# Altium schematic sheet Thunderscope_Rev5.3.SchDoc
size 297 x 209 mm
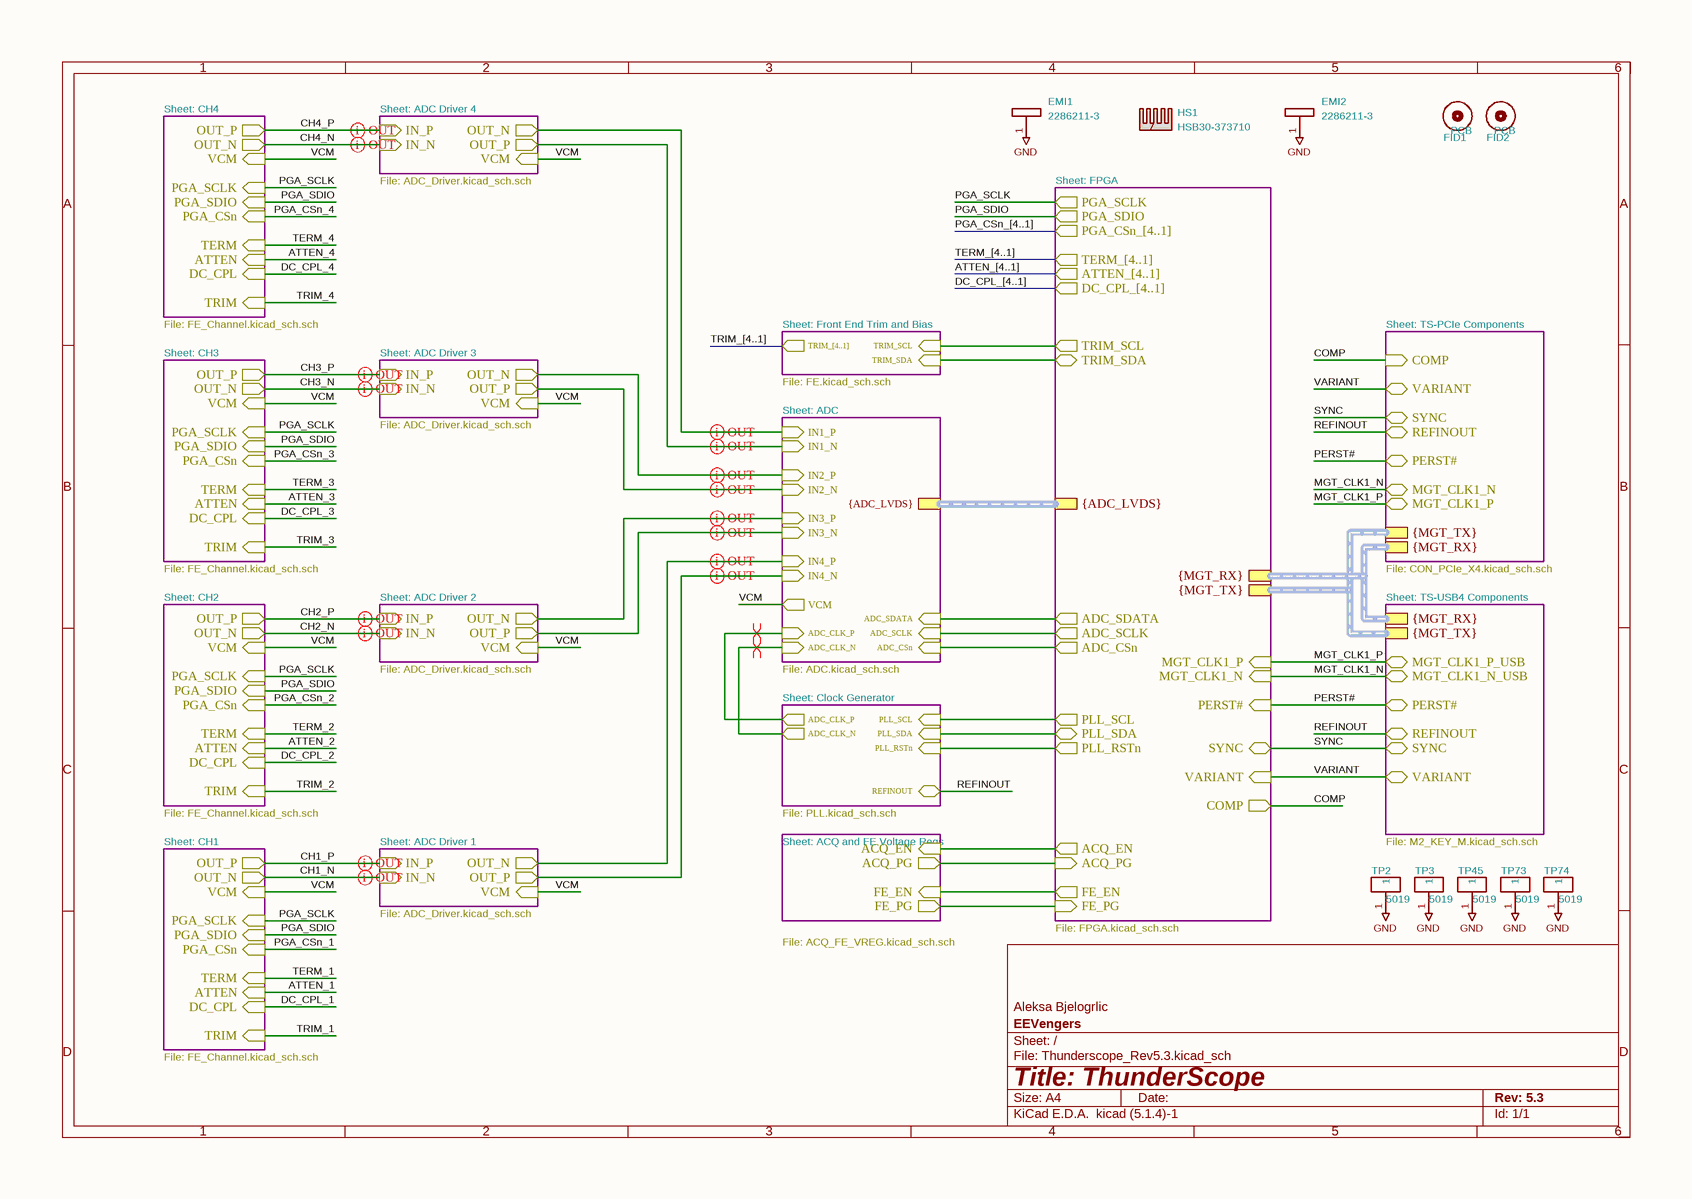
[diagram p0: Thunderscope_Rev5.3.SchDoc]

## Parts
EMI1  2286211-3  [TE_2286211-3]
EMI2  2286211-3  [TE_2286211-3]
FID1  PCB  [GEN_FID]
FID2  PCB  [GEN_FID]
HS1  HSB30-373710  [SSKY_HSB30-373710]  (mechanical)
TP2  5019  [KEY_5019]
TP3  5019  [KEY_5019]  (mechanical)
TP45  5019  [KEY_5019]  (mechanical)
TP73  5019  [KEY_5019]  (mechanical)
TP74  5019  [KEY_5019]  (mechanical)

## Sub-sheets
ACQ and FE Voltage Regs = ACQ_FE_VREG.SchDoc: FE_EN (in), ACQ_EN (in), FE_PG (out), ACQ_PG (out)
ADC = ADC.SchDoc: IN4_N (in), IN4_P (in), IN3_N (in), IN3_P (in), IN2_N (in), IN2_P (in), VCM (out), IN1_N (in), IN1_P (in), ADC_CSn (in), ADC_SDATA (in), ADC_SCLK (in), ADC_CLK_P (in), ADC_CLK_N (in), {ADC_LVDS} (harness ADC_LVDS)
ADC Driver 1 = ADC_Driver.SchDoc: VCM (in), OUT_N (out), OUT_P (out), IN_N (in), IN_P (in)
ADC Driver 2 = ADC_Driver.SchDoc: VCM (in), OUT_N (out), OUT_P (out), IN_N (in), IN_P (in)
ADC Driver 3 = ADC_Driver.SchDoc: VCM (in), OUT_N (out), OUT_P (out), IN_N (in), IN_P (in)
ADC Driver 4 = ADC_Driver.SchDoc: VCM (in), OUT_N (out), OUT_P (out), IN_N (in), IN_P (in)
CH1 = FE_Channel.SchDoc: OUT_P (out), VCM (in), OUT_N (out), TRIM (in), ATTEN (in), DC_CPL (in), PGA_CSn (in), PGA_SCLK (in), PGA_SDIO (in), TERM (in)
CH2 = FE_Channel.SchDoc: OUT_P (out), VCM (in), OUT_N (out), TRIM (in), ATTEN (in), DC_CPL (in), PGA_CSn (in), PGA_SCLK (in), PGA_SDIO (in), TERM (in)
CH3 = FE_Channel.SchDoc: OUT_P (out), VCM (in), OUT_N (out), TRIM (in), ATTEN (in), DC_CPL (in), PGA_CSn (in), PGA_SCLK (in), PGA_SDIO (in), TERM (in)
CH4 = FE_Channel.SchDoc: OUT_P (out), VCM (in), OUT_N (out), TRIM (in), ATTEN (in), DC_CPL (in), PGA_CSn (in), PGA_SCLK (in), PGA_SDIO (in), TERM (in)
Clock Generator = PLL.SchDoc: ADC_CLK_P (out), ADC_CLK_N (out), PLL_RSTn (in), PLL_SDA (in), PLL_SCL (in), REFINOUT (bidir)
FPGA = FPGA.SchDoc: PLL_RSTn (out), ADC_CSn (out), FE_EN (out), PGA_SDIO (out), PGA_SCLK (out), PLL_SCL (out), PLL_SDA (bidir), TRIM_SCL (out), TRIM_SDA (bidir), ADC_SDATA (out), ADC_SCLK (out), ACQ_EN (out), FE_PG (in), ACQ_PG (in), ATTEN_[4..1] (out), TERM_[4..1] (out), DC_CPL_[4..1] (out), PGA_CSn_[4..1] (out), SYNC (bidir), PERST# (in), MGT_CLK1_P (in), MGT_CLK1_N (in), VARIANT (in), COMP (out), {ADC_LVDS}, {MGT_TX}, {MGT_RX}
Front End Trim and Bias = FE.SchDoc: TRIM_SCL (in), TRIM_SDA (in), TRIM_[4..1] (out)
TS-PCIe Components = CON_PCIe_X4.SchDoc: PERST# (bidir), REFINOUT (bidir), SYNC (bidir), MGT_CLK1_N (bidir), MGT_CLK1_P (bidir), VARIANT (bidir), COMP (in), {MGT_RX} (harness MGT_RX), {MGT_TX} (harness MGT_TX)
TS-USB4 Components = M2_KEY_M.SchDoc: REFINOUT (bidir), SYNC (bidir), PERST# (bidir), MGT_CLK1_N_USB (bidir), MGT_CLK1_P_USB (bidir), VARIANT (bidir), {MGT_TX} (harness MGT_TX), {MGT_RX} (harness MGT_RX)

## Nets
GND: EMI1.1 EMI2.1 TP2.1 TP3.1 TP45.1 TP73.1 TP74.1
ATTEN_1: sheet CH1/ATTEN
ATTEN_2: sheet CH2/ATTEN
ATTEN_3: sheet CH3/ATTEN
ATTEN_4: sheet CH4/ATTEN
CH1_N: sheet ADC Driver 1/IN_N, sheet CH1/OUT_N
CH1_P: sheet ADC Driver 1/IN_P, sheet CH1/OUT_P
CH2_N: sheet ADC Driver 2/IN_N, sheet CH2/OUT_N
CH2_P: sheet ADC Driver 2/IN_P, sheet CH2/OUT_P
CH3_N: sheet CH3/OUT_N, sheet ADC Driver 3/IN_N
CH3_P: sheet CH3/OUT_P, sheet ADC Driver 3/IN_P
CH4_N: sheet CH4/OUT_N, sheet ADC Driver 4/IN_N
CH4_P: sheet CH4/OUT_P, sheet ADC Driver 4/IN_P
COMP: sheet FPGA/COMP, sheet TS-PCIe Components/COMP
DC_CPL_1: sheet CH1/DC_CPL
DC_CPL_2: sheet CH2/DC_CPL
DC_CPL_3: sheet CH3/DC_CPL
DC_CPL_4: sheet CH4/DC_CPL
MGT_CLK1_N: sheet FPGA/MGT_CLK1_N, sheet TS-USB4 Components/MGT_CLK1_N_USB, sheet TS-PCIe Components/MGT_CLK1_N
MGT_CLK1_P: sheet FPGA/MGT_CLK1_P, sheet TS-USB4 Components/MGT_CLK1_P_USB, sheet TS-PCIe Components/MGT_CLK1_P
PERST#: sheet FPGA/PERST#, sheet TS-USB4 Components/PERST#, sheet TS-PCIe Components/PERST#
PGA_CSn_1: sheet CH1/PGA_CSn
PGA_CSn_2: sheet CH2/PGA_CSn
PGA_CSn_3: sheet CH3/PGA_CSn
PGA_CSn_4: sheet CH4/PGA_CSn
PGA_SCLK: sheet CH3/PGA_SCLK, sheet FPGA/PGA_SCLK, sheet CH4/PGA_SCLK, sheet CH2/PGA_SCLK, sheet CH1/PGA_SCLK
PGA_SDIO: sheet CH3/PGA_SDIO, sheet FPGA/PGA_SDIO, sheet CH4/PGA_SDIO, sheet CH2/PGA_SDIO, sheet CH1/PGA_SDIO
REFINOUT: sheet TS-USB4 Components/REFINOUT, sheet Clock Generator/REFINOUT, sheet TS-PCIe Components/REFINOUT
SYNC: sheet FPGA/SYNC, sheet TS-USB4 Components/SYNC, sheet TS-PCIe Components/SYNC
TERM_1: sheet CH1/TERM
TERM_2: sheet CH2/TERM
TERM_3: sheet CH3/TERM
TERM_4: sheet CH4/TERM
TRIM_1: sheet CH1/TRIM
TRIM_2: sheet CH2/TRIM
TRIM_3: sheet CH3/TRIM
TRIM_4: sheet CH4/TRIM
VARIANT: sheet FPGA/VARIANT, sheet TS-USB4 Components/VARIANT, sheet TS-PCIe Components/VARIANT
VCM: sheet CH3/VCM, sheet ADC Driver 1/VCM, sheet ADC Driver 2/VCM, sheet ADC/VCM, sheet ADC Driver 3/VCM, sheet CH4/VCM, sheet CH2/VCM, sheet ADC Driver 4/VCM, sheet CH1/VCM
(unnamed): sheet FPGA/PLL_RSTn, sheet Clock Generator/PLL_RSTn
(unnamed): sheet FPGA/ADC_CSn, sheet ADC/ADC_CSn
(unnamed): sheet FPGA/FE_EN, sheet ACQ and FE Voltage Regs/FE_EN
(unnamed): sheet FPGA/PLL_SCL, sheet Clock Generator/PLL_SCL
(unnamed): sheet FPGA/PLL_SDA, sheet Clock Generator/PLL_SDA
(unnamed): sheet FPGA/TRIM_SCL, sheet Front End Trim and Bias/TRIM_SCL
(unnamed): sheet FPGA/TRIM_SDA, sheet Front End Trim and Bias/TRIM_SDA
(unnamed): sheet FPGA/ADC_SDATA, sheet ADC/ADC_SDATA
(unnamed): sheet FPGA/ADC_SCLK, sheet ADC/ADC_SCLK
(unnamed): sheet FPGA/ACQ_EN, sheet ACQ and FE Voltage Regs/ACQ_EN
(unnamed): sheet FPGA/FE_PG, sheet ACQ and FE Voltage Regs/FE_PG
(unnamed): sheet FPGA/ACQ_PG, sheet ACQ and FE Voltage Regs/ACQ_PG
(unnamed): sheet Clock Generator/ADC_CLK_P, sheet ADC/ADC_CLK_P
(unnamed): sheet Clock Generator/ADC_CLK_N, sheet ADC/ADC_CLK_N
(unnamed): sheet ADC Driver 1/OUT_N, sheet ADC/IN4_P
(unnamed): sheet ADC Driver 1/OUT_P, sheet ADC/IN4_N
(unnamed): sheet ADC Driver 2/OUT_N, sheet ADC/IN3_P
(unnamed): sheet ADC Driver 2/OUT_P, sheet ADC/IN3_N
(unnamed): sheet ADC/IN2_N, sheet ADC Driver 3/OUT_P
(unnamed): sheet ADC/IN2_P, sheet ADC Driver 3/OUT_N
(unnamed): sheet ADC/IN1_N, sheet ADC Driver 4/OUT_P
(unnamed): sheet ADC/IN1_P, sheet ADC Driver 4/OUT_N

## Buses and harness runs
bus ATTEN_[4..1] = sheet FPGA/ATTEN_[4..1]
bus DC_CPL_[4..1] = sheet FPGA/DC_CPL_[4..1]
bus PGA_CSn_[4..1] = sheet FPGA/PGA_CSn_[4..1]
bus TERM_[4..1] = sheet FPGA/TERM_[4..1]
bus TRIM_[4..1] = sheet Front End Trim and Bias/TRIM_[4..1]
harness sheet ADC/{ADC_LVDS} = sheet FPGA/{ADC_LVDS}
harness sheet FPGA/{MGT_RX} = sheet TS-PCIe Components/{MGT_RX} = sheet TS-USB4 Components/{MGT_RX}
harness sheet FPGA/{MGT_TX} = sheet TS-PCIe Components/{MGT_TX} = sheet TS-USB4 Components/{MGT_TX}

## Layout directives
differential pair: (no net found under the mark)
differential pair; differential pair class 100Z_Diff_PGA: CH1_N, CH1_P, CH2_N, CH2_P, CH3_N, CH3_P, CH4_N, CH4_P

## Notes on the sheet
- Sheet: CH4
- Sheet: ADC Driver 4
- File: ADC_Driver.kicad_sch.sch
- Sheet: FPGA
- Sheet: CH3
- File: FE_Channel.kicad_sch.sch
- Sheet: ADC Driver 3
- Sheet: Front End Trim and Bias
- Sheet: TS-PCIe Components
- Sheet: ADC
- File: FE.kicad_sch.sch
- File: CON_PCIe_X4.kicad_sch.sch
- Sheet: CH2
- Sheet: ADC Driver 2
- Sheet: TS-USB4 Components
- Sheet: Clock Generator
- File: ADC.kicad_sch.sch
- Sheet: CH1
- Sheet: ADC Driver 1
- File: PLL.kicad_sch.sch
- Sheet: ACQ and FE Voltage Regs
- File: M2_KEY_M.kicad_sch.sch
- File: ACQ_FE_VREG.kicad_sch.sch
- File: FPGA.kicad_sch.sch
- 1
- 2
- 3
- 4
- 5
- 6
- A
- B
- C
- Aleksa Bjelogrlic
- D
- Title: ThunderScope
- File: Thunderscope_Rev5.3.kicad_sch
- Sheet: /
- EEVengers
- KiCad E.D.A.  kicad (5.1.4)-1
- Size: A4
- Date:
- Rev: 5.3
- Id: 1/1

## Library data of the parts
EMI1 EMI2 = EMI FINGER 2286211-3: MANUFACTURER: TE Connectivity; Substitutions Policy: No Substitutions; SUPPLIER 1: Mouser; SUPPLIER PART NUMBER 1: 571-2286211-3; MANUFACTURER PART NUMBER: 2286211-3; PACKAGE: Surface Mount; Footprint: Thunderscope_Rev5:TE_2286211-3; Value: 2286211-3
FID1 FID2 = FID 1mm: HOUSE PART NUMBER: Fiducial-1; Footprint: Thunderscope_Rev5:GEN_FID; Value: PCB
HS1 = HEATSINK HSB30-373710: MANUFACTURER: Same Sky; SUPPLIER 1: Mouser; SUPPLIER PART NUMBER 1: 179-HSB30-373710; MANUFACTURER PART NUMBER: HSB30-373710; Footprint: Thunderscope_Rev5:SSKY_HSB30-373710; Value: HSB30-373710
TP2 TP3 TP45 TP73 TP74 = TP KEYSTONE 5019: MANUFACTURER: Keystone Electronics; SUPPLIER 1: Mouser; SUPPLIER PART NUMBER 1: 534-5019; MANUFACTURER PART NUMBER: 5019; Footprint: Thunderscope_Rev5:KEY_5019; Value: 5019